# Altium project OFP_VIM_DC_v1.51.PrjPcb
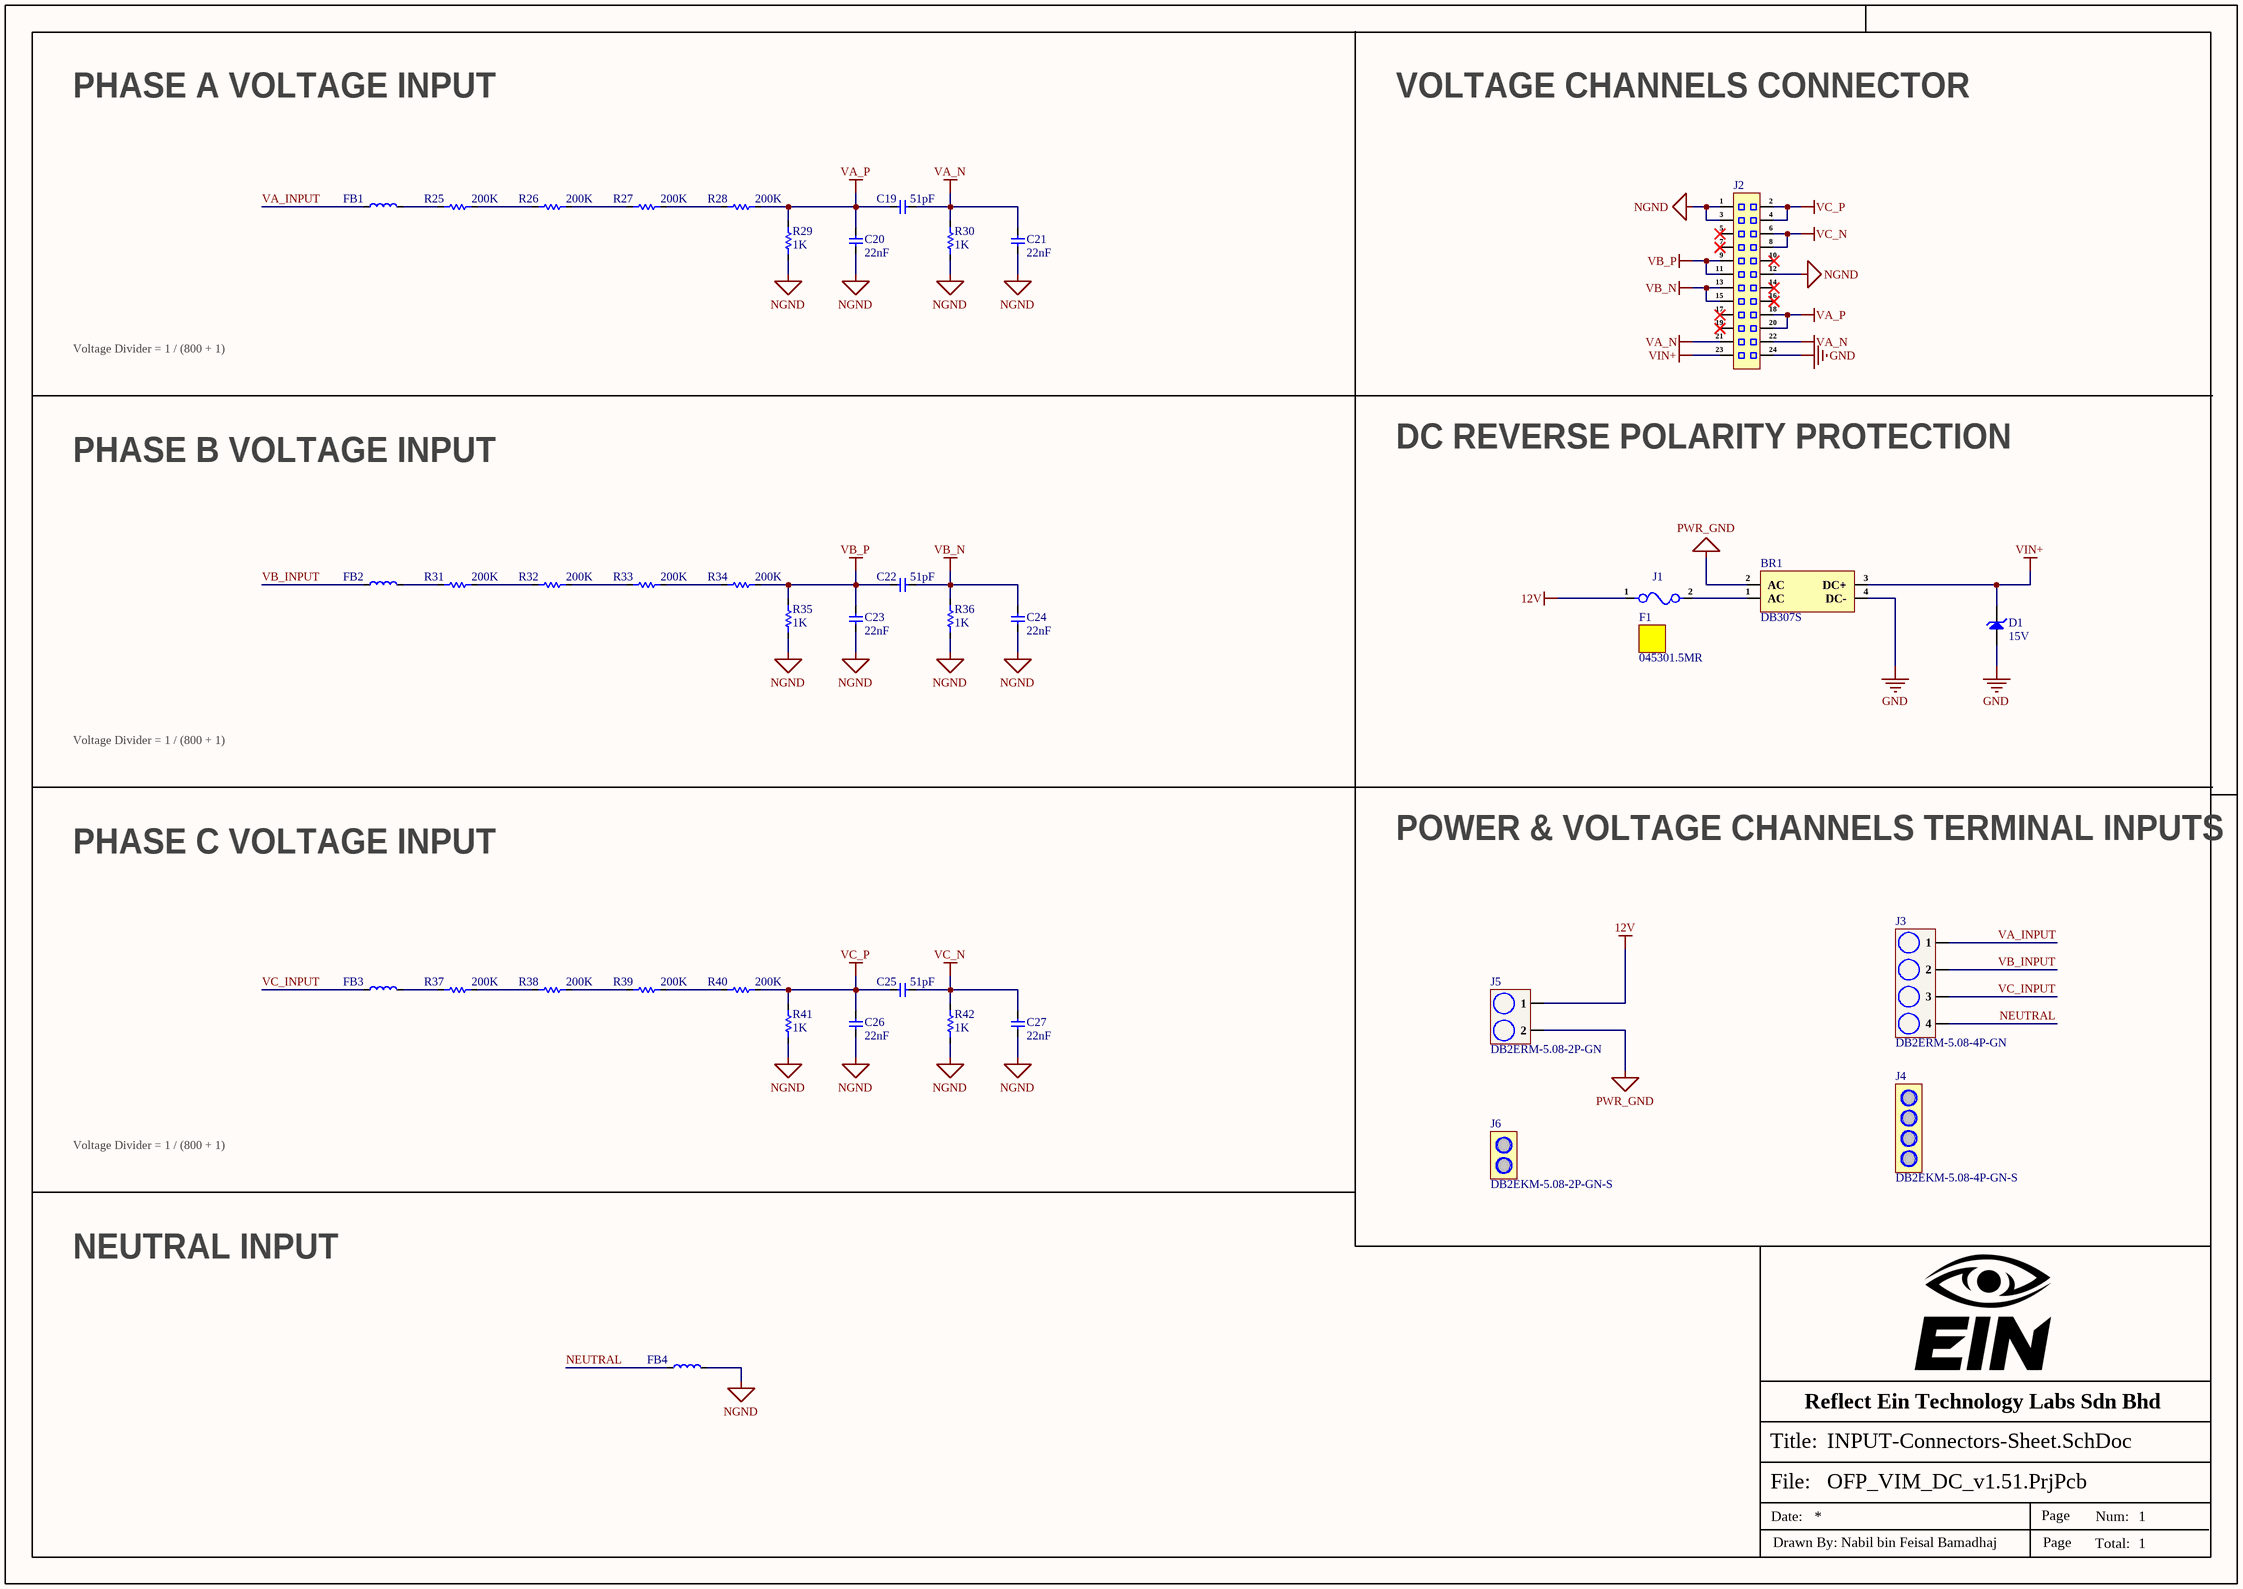
[diagram p0: INPUT-Connectors-Sheet.SchDoc]
1 sheet, 40 parts. Net scope: global (net labels, ports and power ports of the same name join across sheets).
Board file: OFP_VIM_DC_v1.51.PcbDoc

## Sheet INPUT-Connectors-Sheet.SchDoc
size 420 x 297 mm; SheetNumber: 1; SheetTotal: 1

### Parts
BR1  DB307S  [DBS]
C19  51pF  [Cap-0603]
C20  22nF  [Cap-1206]
C21  22nF  [Cap-1206]
C22  51pF  [Cap-0603]
C23  22nF  [Cap-1206]
C24  22nF  [Cap-1206]
C25  51pF  [Cap-0603]
C26  22nF  [Cap-1206]
C27  22nF  [Cap-1206]
D1  15V  [SOD-123W]
F1  045301.5MR  (mechanical)
FB1  BLM21BD152SN1D  [Ind-0805]  (value not drawn)
FB2  BLM21BD152SN1D  [Ind-0805]  (value not drawn)
FB3  BLM21BD152SN1D  [Ind-0805]  (value not drawn)
FB4  BLM21BD152SN1D  [Ind-0805]  (value not drawn)
J1  01550900M  [01550900M]  (value not drawn)
J2  SFH11-PBPC-D12-RA-BK  [SFH11-PBPC-D12-RA-BK]  (value not drawn)
J3  DB2ERM-5.08-4P-GN  [DB2ERM-5.08-4P-GN]
J4  DB2EKM-5.08-4P-GN-S  (mechanical)
J5  DB2ERM-5.08-2P-GN  [DB2ERM-5.08-2P-GN]
J6  DB2EKM-5.08-2P-GN-S  (mechanical)
R25  200K  [RES-2512]
R26  200K  [RES-2512]
R27  200K  [RES-2512]
R28  200K  [RES-2512]
R29  1K  [RES-2512]
R30  1K  [RES-2512]
R31  200K  [RES-2512]
R32  200K  [RES-2512]
R33  200K  [RES-2512]
R34  200K  [RES-2512]
R35  1K  [RES-2512]
R36  1K  [RES-2512]
R37  200K  [RES-2512]
R38  200K  [RES-2512]
R39  200K  [RES-2512]
R40  200K  [RES-2512]
R41  1K  [RES-2512]
R42  1K  [RES-2512]

### Nets
12V: J1.1 J5.1
GND: BR1.4(DC-) D1.1(A) J2.24
NGND: C20.1 C21.1 C23.1 C24.1 C26.1 C27.1 FB4.2 J2.1 J2.3 J2.12 R29.1 R30.1 R35.1 R36.1 R41.1 R42.1
PWR_GND: BR1.2(AC) J5.2
VA_N: C19.2 C21.2 J2.21 J2.22 R30.2
VA_P: C19.1 C20.2 J2.18 J2.20 R28.2 R29.2
VB_N: C22.2 C24.2 J2.13 J2.15 R36.2
VB_P: C22.1 C23.2 J2.9 J2.11 R34.2 R35.2
VC_N: C25.2 C27.2 J2.6 J2.8 R42.2
VC_P: C25.1 C26.2 J2.2 J2.4 R40.2 R41.2
VIN+: BR1.3(DC+) D1.2(K) J2.23
NEUTRAL: FB4.1 J3.4
VA_INPUT: FB1.1 J3.1
VB_INPUT: FB2.1 J3.2
VC_INPUT: FB3.1 J3.3
NetBR1_1: BR1.1(AC) J1.2
NetFB1_2: FB1.2 R25.1
NetFB2_2: FB2.2 R31.1
NetFB3_2: FB3.2 R37.1
NetR25_2: R25.2 R26.1
NetR26_2: R26.2 R27.1
NetR27_2: R27.2 R28.1
NetR31_2: R31.2 R32.1
NetR32_2: R32.2 R33.1
NetR33_2: R33.2 R34.1
NetR37_2: R37.2 R38.1
NetR38_2: R38.2 R39.1
NetR39_2: R39.2 R40.1

Not connected (* = marked no-connect by the designer): J2 5* 7* 10* 14* 16* 17* 19*

### Notes on the sheet
- PHASE A VOLTAGE INPUT
- VOLTAGE CHANNELS CONNECTOR
- Voltage Divider = 1 / (800 + 1)
- PHASE B VOLTAGE INPUT
- DC REVERSE POLARITY PROTECTION
- PHASE C VOLTAGE INPUT
- POWER & VOLTAGE CHANNELS TERMINAL INPUTS
- NEUTRAL INPUT
- Reflect Ein Technology Labs Sdn Bhd
- File:
- Title:
- Date:
- Page
- Num:
- Total:
- Drawn By: Nabil bin Feisal Bamadhaj

### Library data of the parts
BR1 = DB307S: 60A 1.1V@3A 3A 1kV DBS Bridge Rectifiers ROHS; Manufacturer: GOODWORK; Manufacturer Part Number: DB307S; Package: DBS; LCSC Part Number: C525744; Item Type: Bridge Rectifiers; ComponentLink1Description: LCSC; ComponentLink1URL: https://lcsc.com/product-detail/Bridge-Rectifiers_GOODWORK-DB307S_C525744.html?s_z=n_LMB8S-TP
C19 C22 C25 = GQM1875C2E510FB12D: 51 pF ±1% 250V Ceramic Capacitor C0G, NP0 0603 (1608 Metric); Manufacturer: Murata; Item Type: Capacitors; Supplier: Mouser; LCSC Part Number: C17504198; Manufacturer Part Number: GQM1875C2E510FB12D; RoHS: Yes; Stock: 1634; Pricing: 1=0.58, 10=0.26, 50=0.26, 100=0.181, 1000=0.16, 10000=0.122 (USD)
C20 C21 C23 C24 C26 C27 = CC1206KKX7RBBB223: CAP CER 0.022UF 500V X7R 1206; Manufacturer: Yageo; Item Type: Capacitors; Supplier: Future Electronics; LCSC Part Number: C326702; Manufacturer Part Number: CC1206KKX7RBBB223; RoHS: Yes; Stock: 660000; Pricing: 3000=0.0421, 6000=0.0414, 12000=0.0407, 15000=0.0405, 45000=0.0392 (USD); Lead Free: 5697LeadFree; ComponentLink1URL: http://www.mouser.com/ds/2/447/Yageo_UPY-GP_NP0_16V-to-50V_9-358835.pdf?src-supplier=Mouser; ComponentLink1Description: http://www.mouser.com/ds/2/447/Yageo_UPY-GP_NP0_16V-to-50V_9-358835.pdf?src-supplier=Mouser; ComponentLink2URL: http://www.yageo.com/documents/recent/UPY-NP0X7R_MV_100-to-630V_9.pdf?src-supplier=Avnet; ComponentLink2Description: http://www.yageo.com/documents/recent/UPY-NP0X7R_MV_100-to-630V_9.pdf?src-supplier=Avnet; ComponentLink3URL: http://www.yageo.com/documents/recent/UPY-NP0X7R_MV_100-to-630V_19.pdf?src-supplier=Digikey; ComponentLink3Description: http://www.yageo.com/documents/recent/UPY-NP0X7R_MV_100-to-630V_19.pdf?src-supplier=Digikey; ComponentLink4URL: http://www.yageo.com/documents/recent/UPY-NP0X7R_MV_100-to-630V_21.pdf?src-supplier=Digikey; ComponentLink4Description: http://www.yageo.com/documents/recent/UPY-NP0X7R_MV_100-to-630V_21.pdf?src-supplier=Digikey; ComponentLink5URL: https://www.yageo.com/upload/media/product/products/datasheet/mlcc/UPY-NP0X7R_MV_100-to-630V_21.pdf?src-supplier=Digikey; ComponentLink5Description: https://www.yageo.com/upload/media/product/products/datasheet/mlcc/UPY-NP0X7R_MV_100-to-630V_21.pdf?src-supplier=Digikey; ComponentLink6URL: http://www.yageo.com/documents/recent/UPY-NP0X7R_MV_100-to-630V_9.pdf?src-supplier=Future+Electronics; ComponentLink6Description: http://www.yageo.com/documents/recent/UPY-NP0X7R_MV_100-to-630V_9.pdf?src-supplier=Future+Electronics; ComponentLink7URL: https://datasheet.octopart.com/CC1206KKX7RBBB223-Yageo-datasheet-10979222.pdf?src-supplier=Future+Electronics; ComponentLink7Description: https://datasheet.octopart.com/CC1206KKX7RBBB223-Yageo-datasheet-10979222.pdf?src-supplier=Future+Electronics
D1 = MMSZ5245B-7-F: DIODE ZENER 15V 500MW SOD123; Manufacturer: Diodes; Reverse Voltage: 11V; Supplier: Arrow Electronics; LCSC Part Number: C177050; Manufacturer Part Number: MMSZ5245B-7-F; RoHS: Yes; Item Type: Diodes; Stock: 414000; Pricing: 6000=0.0138 (USD); ComponentLink1URL: https://datasheet.ciiva.com/15142/getdatasheetpartid-110401-15142750.pdf?src-supplier=Verical; ComponentLink1Description: https://datasheet.ciiva.com/15142/getdatasheetpartid-110401-15142750.pdf?src-supplier=Verical; ComponentLink2URL: https://datasheet.ciiva.com/890/ds18010-890775.pdf?src-supplier=Digikey; ComponentLink2Description: https://datasheet.ciiva.com/890/ds18010-890775.pdf?src-supplier=Digikey; ComponentLink3URL: https://datasheet.ciiva.com/890/ds18010-890776.pdf?src-supplier=Digikey; ComponentLink3Description: https://datasheet.ciiva.com/890/ds18010-890776.pdf?src-supplier=Digikey; ComponentLink4URL: https://datasheet.ciiva.com/890/ds18010-890777.pdf?src-supplier=Digikey; ComponentLink4Description: https://datasheet.ciiva.com/890/ds18010-890777.pdf?src-supplier=Digikey; ComponentLink5URL: https://datasheet.ciiva.com/8025/ds18010-8025783.pdf?src-supplier=Element14; ComponentLink5Description: https://datasheet.ciiva.com/8025/ds18010-8025783.pdf?src-supplier=Element14
F1 = 045301.5MR: FUSE BRD MNT 1.5A 125VAC/VDC SMD; Manufacturer: Littelfuse; Item Type: Fuses; Supplier: Digikey; LCSC Part Number: C178994; Manufacturer Part Number: 045301.5MR; RoHS: Yes; Stock: 1398; Pricing: 1=1.32, 5=1.276, 10=1.193, 50=0.9874, 100=0.8228, 250=0.80224, 500=0.67882 (USD); ComponentLink1URL: https://datasheet.ciiva.com/16378/littelfuse-fuse-451-453-16378313.pdf?src-supplier=Future+Electronics; ComponentLink1Description: https://datasheet.ciiva.com/16378/littelfuse-fuse-451-453-16378313.pdf?src-supplier=Future+Electronics; ComponentLink2URL: https://datasheet.ciiva.com/7991/littelfuse-fuse-451-453-7991903.pdf?src-supplier=Element14; ComponentLink2Description: https://datasheet.ciiva.com/7991/littelfuse-fuse-451-453-7991903.pdf?src-supplier=Element14; ComponentLink3URL: https://datasheet.ciiva.com/46406/1788341-46406156.pdf?src-supplier=Element14; ComponentLink3Description: https://datasheet.ciiva.com/46406/1788341-46406156.pdf?src-supplier=Element14; ComponentLink4URL: https://datasheet.ciiva.com/300/littelfuse-fuse-451-453-300028.pdf?src-supplier=Digikey; ComponentLink4Description: https://datasheet.ciiva.com/300/littelfuse-fuse-451-453-300028.pdf?src-supplier=Digikey; ComponentLink5URL: https://datasheet.ciiva.com/15187/getdatasheetpartid-221064-15187549.pdf?src-supplier=Verical; ComponentLink5Description: https://datasheet.ciiva.com/15187/getdatasheetpartid-221064-15187549.pdf?src-supplier=Verical; ComponentLink6URL: https://datasheet.ciiva.com/300/littelfuse-fuse-451-453-300029.pdf?src-supplier=Digikey; ComponentLink6Description: https://datasheet.ciiva.com/300/littelfuse-fuse-451-453-300029.pdf?src-supplier=Digikey; ComponentLink7URL: https://datasheet.ciiva.com/300/littelfuse-fuse-451-453-300030.pdf?src-supplier=Digikey; ComponentLink7Description: https://datasheet.ciiva.com/300/littelfuse-fuse-451-453-300030.pdf?src-supplier=Digikey; ComponentLink8URL: https://datasheet.ciiva.com/299/littelfuse-fuse-451-453-299721.pdf?src-supplier=Digikey; ComponentLink8Description: https://datasheet.ciiva.com/299/littelfuse-fuse-451-453-299721.pdf?src-supplier=Digikey; ComponentLink9URL: https://datasheet.ciiva.com/299/littelfuse-fuse-451-453-299722.pdf?src-supplier=Digikey; ComponentLink9Description: https://datasheet.ciiva.com/299/littelfuse-fuse-451-453-299722.pdf?src-supplier=Digikey; ComponentLink10URL: https://datasheet.ciiva.com/299/littelfuse-fuse-451-453-299723.pdf?src-supplier=Digikey; ComponentLink10Description: https://datasheet.ciiva.com/299/littelfuse-fuse-451-453-299723.pdf?src-supplier=Digikey
FB1-FB4 = BLM21BD152SN1D: FERRITE BEAD 1.5 KOHM 0805 1LN; Manufacturer: Murata; Item Type: Ferrite Beads; RMS Current (Irms): 250mA; ESR: 450mR; Shielding: 202Shielding; Frequency: 100MHz; Number of Circuits: 1NUMBER; Supplier: Mouser; LCSC Part Number: C413959; Manufacturer Part Number: BLM21BD152SN1D; RoHS: Yes; Stock: 31999; Pricing: 1=0.21, 10=0.114, 50=0.114, 100=0.102, 1000=0.068, 10000=0.048 (USD); Lead Free: 5697LeadFree; ComponentLink1URL: https://datasheet.ciiva.com/19454/1845267-19454720.pdf?src-supplier=Jameco; ComponentLink1Description: https://datasheet.ciiva.com/19454/1845267-19454720.pdf?src-supplier=Jameco; ComponentLink2URL: https://datasheet.ciiva.com/14122/amblm21b-data-e-14122891.pdf?src-supplier=Distrelec; ComponentLink2Description: https://datasheet.ciiva.com/14122/amblm21b-data-e-14122891.pdf?src-supplier=Distrelec; ComponentLink3URL: https://datasheet.ciiva.com/6211/l0110s0100blm21b-6211484.pdf?src-supplier=Digikey; ComponentLink3Description: https://datasheet.ciiva.com/6211/l0110s0100blm21b-6211484.pdf?src-supplier=Digikey; ComponentLink4URL: https://datasheet.ciiva.com/6211/l0110s0100blm21b-6211486.pdf?src-supplier=Digikey; ComponentLink4Description: https://datasheet.ciiva.com/6211/l0110s0100blm21b-6211486.pdf?src-supplier=Digikey; ComponentLink5URL: https://datasheet.ciiva.com/6211/l0110s0100blm21b-6211487.pdf?src-supplier=Digikey; ComponentLink5Description: https://datasheet.ciiva.com/6211/l0110s0100blm21b-6211487.pdf?src-supplier=Digikey; ComponentLink6URL: https://datasheet.ciiva.com/16420/l0110s0100blm21b-16420715.pdf?src-supplier=Future+Electronics; ComponentLink6Description: https://datasheet.ciiva.com/16420/l0110s0100blm21b-16420715.pdf?src-supplier=Future+Electronics; ComponentLink7URL: https://datasheet.ciiva.com/17277/l0110s0100blm21b-17277370.pdf?; ComponentLink7Description: https://datasheet.ciiva.com/17277/l0110s0100blm21b-17277370.pdf?
J1 = 01550900M: FUSE BLOK CARTRIDGE 125V 10A SMD; Manufacturer: Littelfuse; Item Type: Fuse Holders; Supplier: Digikey; LCSC Part Number: C108518; Manufacturer Part Number: 01550900M; RoHS: Yes; Stock: 4038; Pricing: 1=2.5, 5=2.072, 10=1.912, 50=1.586, 100=1.4631, 250=1.31448, 500=1.21164, 1000=1.11633, 5000=1.06138 (USD); Lead Free: 5697LeadFree; Reach SVHC Compliant: 4187SVHC; ComponentLink1URL: https://datasheet.ciiva.com/3812/01550900m-3812998.pdf?src-supplier=Arrow+Electronics; ComponentLink1Description: https://datasheet.ciiva.com/3812/01550900m-3812998.pdf?src-supplier=Arrow+Electronics
J2 = SFH11-PBPC-D12-RA-BK: CONN HDR 24POS 0.1 GOLD PCB R/A; Manufacturer: Sullins; Item Type: Connectors; Number of Positions: 24; Connector Type: Header; Pitch: 0.1inch; Supplier: Digikey; Manufacturer Part Number: SFH11-PBPC-D12-RA-BK; RoHS: Yes; Pricing: 1000=0.8853 (USD); Mounting Technology: Through Hole; Color: Black; Contact Plating: Gold; Package Quantity: 1000; Packaging: Tray; Number of Rows: 2; Termination: Solder; Series: SFH11; Contact Type: Female Socket; Row Spacing: 0.1inch; RoHS Compliant: Yes; ComponentLink1URL: http://sullinscorp.com/catalogs/147_PAGE119_.100_SFH11_SERIES_FEMALE_HDR_ST_RA.pdf?src-supplier=Digikey; ComponentLink1Description: http://sullinscorp.com/catalogs/147_PAGE119_.100_SFH11_SERIES_FEMALE_HDR_ST_RA.pdf?src-supplier=Digikey
J3 = DB2ERM-5.08-4P-GN: 320V 20A 4 Bend -40℃~+105℃ 1 5.08mm 1x4P Green Receptacle-Close Screw Fixing Push-Pull,P=5.08mm Pluggable System Terminal Block ROHS; Manufacturer: DORABO; Manufacturer Part Number: DB2ERM-5.08-4P-GN; Package: Push-Pull,P=5.08mm; LCSC Part Number: C395755; Item Type: Terminal Block; ComponentLink1Description: LCSC; ComponentLink1URL: https://www.lcsc.com/product-detail/Pluggable-System-Terminal-Block_DORABO-DB2ERM-5-08-4P-GN_C395755.html?s_z=n_DB2ERM-5.08-4P-GN
J4 = DB2EKM-5.08-4P-GN-S: -40℃~+105℃ 2.5 1 14~28 5.08mm 320V 20A 4 1x4P Green Plug Screw Fixing P=5.08mm Pluggable System Terminal Block ROHS; Manufacturer: DORABO; Manufacturer Part Number: DB2EKM-5.08-4P-GN-S; Package: P=5.08mm; LCSC Part Number: C395756; Item Type: Terminal Block; ComponentLink1Description: LCSC; ComponentLink1URL: https://www.lcsc.com/product-detail/Pluggable-System-Terminal-Block_DORABO-DB2EKM-5-08-4P-GN-S_C395756.html?s_z=n_DB2EKM-5.08-4P-GN-S
J5 = DB2ERM-5.08-2P-GN: 320V 20A 2 Right-Angle Pin -40℃~+105℃ 1 5.08mm 1x2P Green Board Side/Socket - Closed Screw Push-Pull,P=5.08mm Pluggable System Terminal Block ROHS; Manufacturer: DORABO; Manufacturer Part Number: DB2ERM-5.08-2P-GN; Package: Push-Pull,P=5.08mm; LCSC Part Number: C395735; Item Type: Terminal Block; ComponentLink1Description: LCSC; ComponentLink1URL: https://lcsc.com/product-detail/Pluggable-System-Terminal-Block_DORABO-DB2ERM-5-08-2P-GN_C395735.html?s_z=n_DB2ERM-5.08-2P-GN
J6 = DB2EKM-5.08-2P-GN-S: 40℃~+105℃ 2.5 1 14~28 5.08mm 320V 20A 2 1x2P Green Plug Screw P=5.08mm Pluggable System Terminal Block ROHS; Manufacturer: DORABO; Manufacturer Part Number: DB2EKM-5.08-2P-GN-S; Package: P=5.08mm; LCSC Part Number: C395731; Item Type: Terminal Block; ComponentLink1Description: LCSC; ComponentLink1URL: https://lcsc.com/product-detail/Pluggable-System-Terminal-Block_DORABO-DB2EKM-5-08-2P-GN-S_C395731.html?s_z=n_DB2EKM-5.08-2P-GN-S
R25-R28 R31-R34 R37-R40 = CRCW2512200KFKEG: RES SMD 200K OHM 1% 1W 2512; Manufacturer: Vishay Dale; Item Type: Resistors; Voltage Rating (DC): 500V; Supplier: Mouser; LCSC Part Number: C2078538; Manufacturer Part Number: CRCW2512200KFKEG; RoHS: Yes; Stock: 29311; Pricing: 1=0.3, 10=0.127, 50=0.127, 100=0.082, 1000=0.067, 10000=0.047 (USD); Lead Free: 5697LeadFree; ComponentLink1URL: https://datasheet.ciiva.com/16435/dcrcwe3-16435690.pdf?src-supplier=Future+Electronics; ComponentLink1Description: https://datasheet.ciiva.com/16435/dcrcwe3-16435690.pdf?src-supplier=Future+Electronics; ComponentLink2URL: https://datasheet.ciiva.com/5545/dcrcwe3-109170-5545692.pdf?src-supplier=Mouser; ComponentLink2Description: https://datasheet.ciiva.com/5545/dcrcwe3-109170-5545692.pdf?src-supplier=Mouser
R29 R30 R35 R36 R41 R42 = RC2512JK-071KL: RES 1K OHM 5% 1W 2512; Manufacturer: Yageo; Value: 1kR; Voltage Rating: 200V; Temperature Coefficient: 100ppm/°C; Item Type: Resistor; Supplier: Future Electronics; Supplier Part Number: 9067984; Manufacturer Part Number: RC2512JK-071KL; RoHS: Yes; Category: Chip SMD Resistors; Stock: 596000; Pricing: 4000=0.0216, 16000=0.0207, 40000=0.0201, 100000=0.0195, 160000=0.0187 (USD); Case/Package: 2512; Case Code (Imperial): 2512; Case Code (Metric): 6432; Contact Plating: Tin,Lead; Min Operating Temperature: -55°C; Max Operating Temperature: 155°C; Power Rating: 1W; Packaging: Tape and Reel; Tolerance: 5%; Resistor Type: Thick Film; Number of Terminations: 2; Termination: SMD/SMT; Max Power Dissipation: 1W; Working Voltage: 200V; Features: Moisture Resistant; Series: RC; Technology: THICK FILM; Resistance Tolerance: 5%; Length: 0.25inch; Width: 3.1mm; Height: 0.026inch; RoHS Compliant: Yes; Reach SVHC Compliant: Unknown; Lead Free: 5697LeadFree; ComponentLink1URL: https://datasheet.ciiva.com/5595/pyu-rc2512-51-rohs-l-4-5595927.pdf?src-supplier=Mouser; ComponentLink1Description: https://datasheet.ciiva.com/5595/pyu-rc2512-51-rohs-l-4-5595927.pdf?src-supplier=Mouser; ComponentLink2URL: https://datasheet.ciiva.com/7672/638316-7672039.pdf?src-supplier=Element14; ComponentLink2Description: https://datasheet.ciiva.com/7672/638316-7672039.pdf?src-supplier=Element14; ComponentLink3URL: https://datasheet.ciiva.com/7672/638316-7672038.pdf?src-supplier=Element14; ComponentLink3Description: https://datasheet.ciiva.com/7672/638316-7672038.pdf?src-supplier=Element14; LCSC Part Number: C137010